# Altium schematic sheet ECG_AFE_AD8832.SchDoc
size A; SheetNumber: 2; SheetTotal: 4
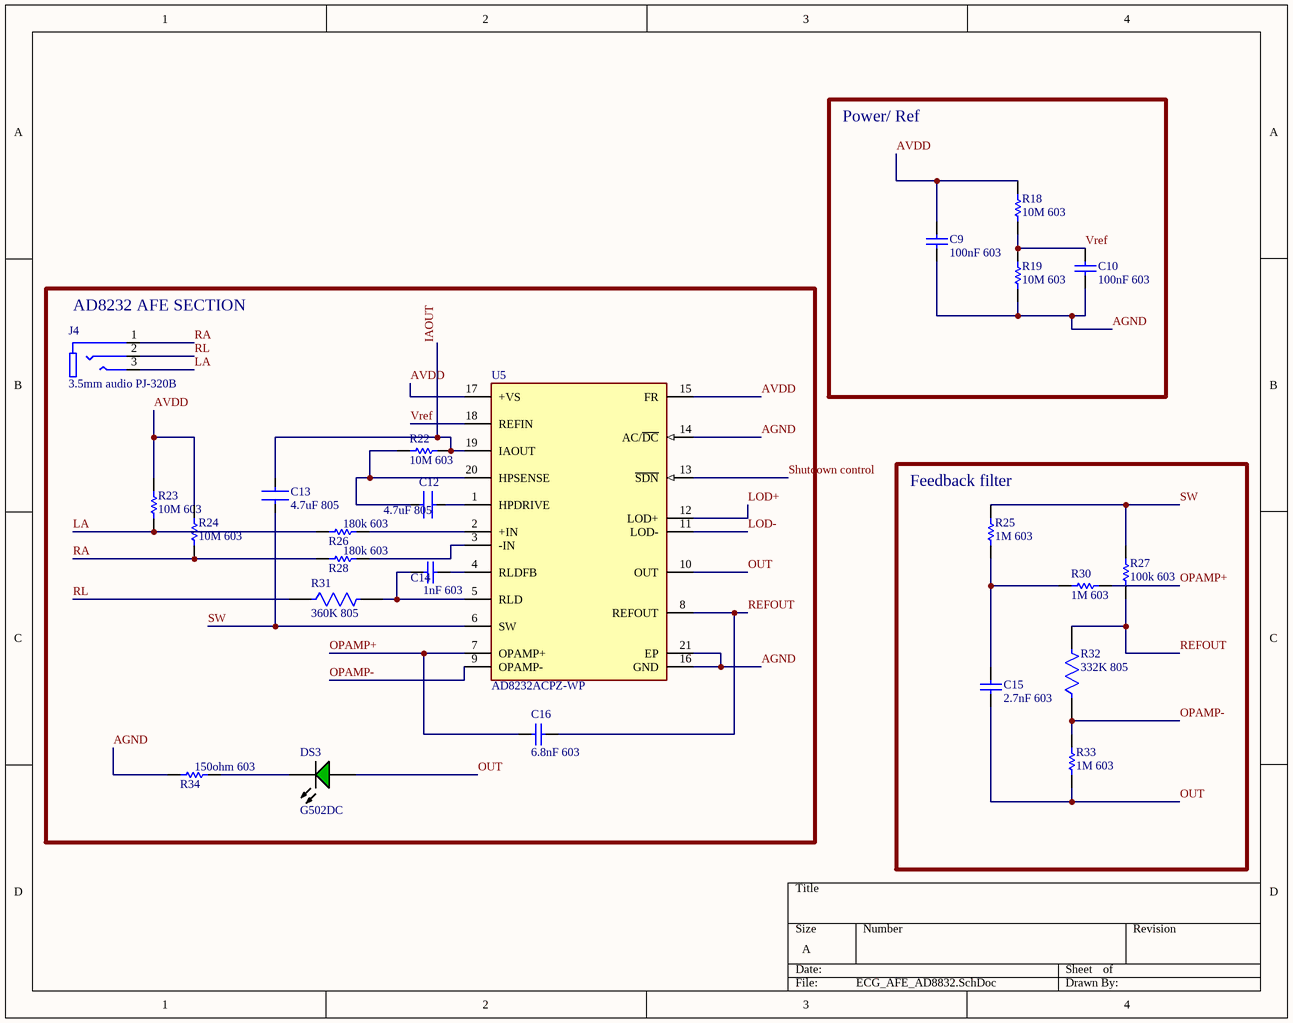
[diagram p0: ECG_AFE_AD8832.SchDoc]

## Parts
C9  100nF 603  [CAP-0603-IPC_B]
C10  100nF 603  [CAP-0603-IPC_B]
C12  4.7uF 805  [CAP-0805-IPC_B]
C13  4.7uF 805  [CAP-0805-IPC_B]
C14  1nF 603  [CAP-0603-IPC_B]
C15  2.7nF 603  [CAP-0603-IPC_B]
C16  6.8nF 603  [CAP-0603-IPC_B]
DS3  G502DC  [CGX-G502DC]
J4  3.5mm audio PJ-320B  [3.5mm Audio PJ-320B]
R18  10M 603  [RES-0603-IPC_B]
R19  10M 603  [RES-0603-IPC_B]
R22  10M 603  [RES-0603-IPC_B]
R23  10M 603  [RES-0603-IPC_B]
R24  10M 603  [RES-0603-IPC_B]
R25  1M 603  [RES-0603-IPC_B]
R26  180k 603  [RES-0603-IPC_B]
R27  100k 603  [RES-0603-IPC_B]
R28  180k 603  [RES-0603-IPC_B]
R30  1M 603  [RES-0603-IPC_B]
R31  360K 805  [RES 0805 Medium]
R32  332K 805  [RES 0805 Medium]
R33  1M 603  [RES-0603-IPC_B]
R34  150ohm 603  [RES-0603-IPC_B]
U5  AD8232ACPZ-WP  [FP-CP-20-8-IPC_A]

## Blocks framed on the sheet
Power/ Ref: C9 C10 R18 R19
AD8232 AFE SECTION: C12-C14 C16 DS3 J4 R22-R24 R26 R28 R31 R34 U5
Feedback filter: C15 R25 R27 R30 R32 R33

## Nets
AGND: C9.1 C10.1 R19.1 R34.1 U5.14(AC/~{DC}) U5.16(GND) U5.21(EP)
AVDD: C9.2 R18.2 R23.2 R24.2 U5.15(FR) U5.17(+VS)
IAOUT: C13.2 R22.2 U5.19(IAOUT)
LA: J4.3(TIP) R23.1 R26.1
LOD+: U5.12(LOD+)
LOD-: U5.11(LOD-)
OPAMP+: C16.1 R30.2 U5.7(OPAMP+)
OPAMP-: R32.1 R33.2 U5.9(OPAMP-)
OUT: C15.1 DS3.1(A) R33.1 U5.10(OUT)
RA: J4.1(SLEEVE) R24.1 R28.1
REFOUT: C16.2 R27.1 R32.2 U5.8(REFOUT)
RL: J4.2(RING) R31.1
Shutdown control: U5.13(~{SDN})
SW: C13.1 R25.2 R27.2 U5.6(SW)
Vref: C10.2 R18.1 R19.2 U5.18(REFIN)
NetC12_1: C12.1 U5.1(HPDRIVE)
NetC12_2: C12.2 R22.1 U5.20(HPSENSE)
NetC14_1: C14.1 R31.2 U5.5(RLD)
NetC14_2: C14.2 U5.4(RLDFB)
NetC15_2: C15.2 R25.1 R30.1
NetDS3_2: DS3.2(K) R34.2
NetR26_2: R26.2 U5.2(+IN)
NetR28_2: R28.2 U5.3(-IN)

## Library data of the parts
C9 C10 = 100nF CAP-0603-IPC-B_1: Manufacturer: AVX Interconnect / Elco; Part Number: 0603ZC103MAT2A
C12 C13 = 4.7uF CAP-0805-IPC-B_1
C14 = 1nF CAP-0603-IPC-B_1: Manufacturer: AVX Interconnect / Elco; Part Number: 0603ZC103MAT2A
C15 = 2.7nF CAP-0603-IPC-B_1: Manufacturer: AVX Interconnect / Elco; Part Number: 0603ZC103MAT2A
C16 = 6.8nF CAP-0603-IPC-B_2: Manufacturer: AVX Interconnect / Elco; Part Number: 0603ZC103MAT2A
DS3 = CMP-007-00008-2: Green LED, 80 mW, 20 mA, -25 to 85 degC, 2-Pin THD; Manufacturer: Shenzhen CGX; Mounting Technology: TH; Package Reference: G502DC; Datasheet Version: Sep-14; Manufacturer URL: http://szcgx.com/; Package Description: 2-Pin Through Hole Device, Dia 5.9 mm; Datasheet URL: http://datasheet.octopart.com/G502DC-Chengguangxing-datasheet-62330340.pdf; Case/Package: G502DC; RoHS Compliant: Unknown
J4 = 3.5mm audio PJ-320B: ÐŸÐ¾Ñ€Ñ‚ Ð´Ð»Ñ Ð½Ð°ÑƒÑˆÐ½Ð¸ÐºÐ¾Ð²; MF: Luoyang Dishang electronics; SnapEDA_Link: https://www.snapeda.com/parts/PJ-320B/Luoyang%20Dishang%20electronics/view-part/5519978/?ref=snap; Value: *; MP: PJ-320B; Availability: Not in stock; Check_prices: https://www.snapeda.com/parts/PJ-320B/Luoyang%20Dishang%20electronics/view-part/5519978/?ref=eda; Package: Package; Price: None
R18 R19 R22-R24 = 10M RES-0603-IPC-B_4: Max Power Dissipation: 100mW; Temperature Coefficient: 50ppm/°C; Tolerance: 0.5%; Resistance: 4.7kR; Height: 0.022inch; Width: 0.032inch; RoHS Compliant: Yes; Features: Moisture Resistant; Packaging: Tape and Reel; Number of Terminations: 2; Max Operating Temperature: 155°C; Series: AT; Min Operating Temperature: -55°C; Resistor Type: Thin Film; Length: 0.063inch; Case/Package: 0603
R25 R30 R33 = 1M RES-0603-IPC-B_3: Max Power Dissipation: 100mW; Temperature Coefficient: 50ppm/°C; Tolerance: 0.5%; Resistance: 4.7kR; Height: 0.022inch; Width: 0.032inch; RoHS Compliant: Yes; Features: Moisture Resistant; Packaging: Tape and Reel; Number of Terminations: 2; Max Operating Temperature: 155°C; Series: AT; Min Operating Temperature: -55°C; Resistor Type: Thin Film; Length: 0.063inch; Case/Package: 0603
R26 R28 = 180k RES-0603-IPC-B_2: Max Power Dissipation: 100mW; Temperature Coefficient: 50ppm/°C; Tolerance: 0.5%; Resistance: 4.7kR; Height: 0.022inch; Width: 0.032inch; RoHS Compliant: Yes; Features: Moisture Resistant; Packaging: Tape and Reel; Number of Terminations: 2; Max Operating Temperature: 155°C; Series: AT; Min Operating Temperature: -55°C; Resistor Type: Thin Film; Length: 0.063inch; Case/Package: 0603
R27 = 100k RES-0603-IPC-B_1: Max Power Dissipation: 100mW; Temperature Coefficient: 50ppm/°C; Tolerance: 0.5%; Resistance: 4.7kR; Height: 0.022inch; Width: 0.032inch; RoHS Compliant: Yes; Features: Moisture Resistant; Packaging: Tape and Reel; Number of Terminations: 2; Max Operating Temperature: 155°C; Series: AT; Min Operating Temperature: -55°C; Resistor Type: Thin Film; Length: 0.063inch; Case/Package: 0603
R31 = 360K RES-0805-IPC_B_2
R32 = 332K RES-0805-IPC_B_1
R34 = 1.5k RES-0603-IPC-B_2: Max Power Dissipation: 100mW; Temperature Coefficient: 50ppm/°C; Tolerance: 0.5%; Resistance: 4.7kR; Height: 0.022inch; Width: 0.032inch; RoHS Compliant: Yes; Features: Moisture Resistant; Packaging: Tape and Reel; Number of Terminations: 2; Max Operating Temperature: 155°C; Series: AT; Min Operating Temperature: -55°C; Resistor Type: Thin Film; Length: 0.063inch; Case/Package: 0603
U5 = CMP-09085-000022-1: IC ECG FRONT END 20LFCSP; Number of Channels: 1; Input Offset Voltage (Vos): 3mV; Slew Rate: 0.2V/µs; Min Supply Voltage: 2V; Power Supply Rejection Ratio (PSRR): 90dB; Max Supply Voltage: 3.5V; Input Bias Current: 200pA; Operating Supply Current: 170uA; Common Mode Rejection Ratio: 80dB; Gain Bandwidth Product: 100kHz; Packaging: Tray; RoHS Compliant: Yes; Radiation Hardening: No; Contact Plating: Tin; Number of Pins: 20; Width: 4.1mm; REACH SVHC: No SVHC; Mount: Surface Mount; Length: 4.1mm; Lead Free: Contains Lead; Case/Package: LFCSP EP; Min Operating Temperature: -40°C; Max Operating Temperature: 85°C; Height: 0.75mm; Series: -